# Altium schematic sheet P1.schdoc (part 3 of 3)
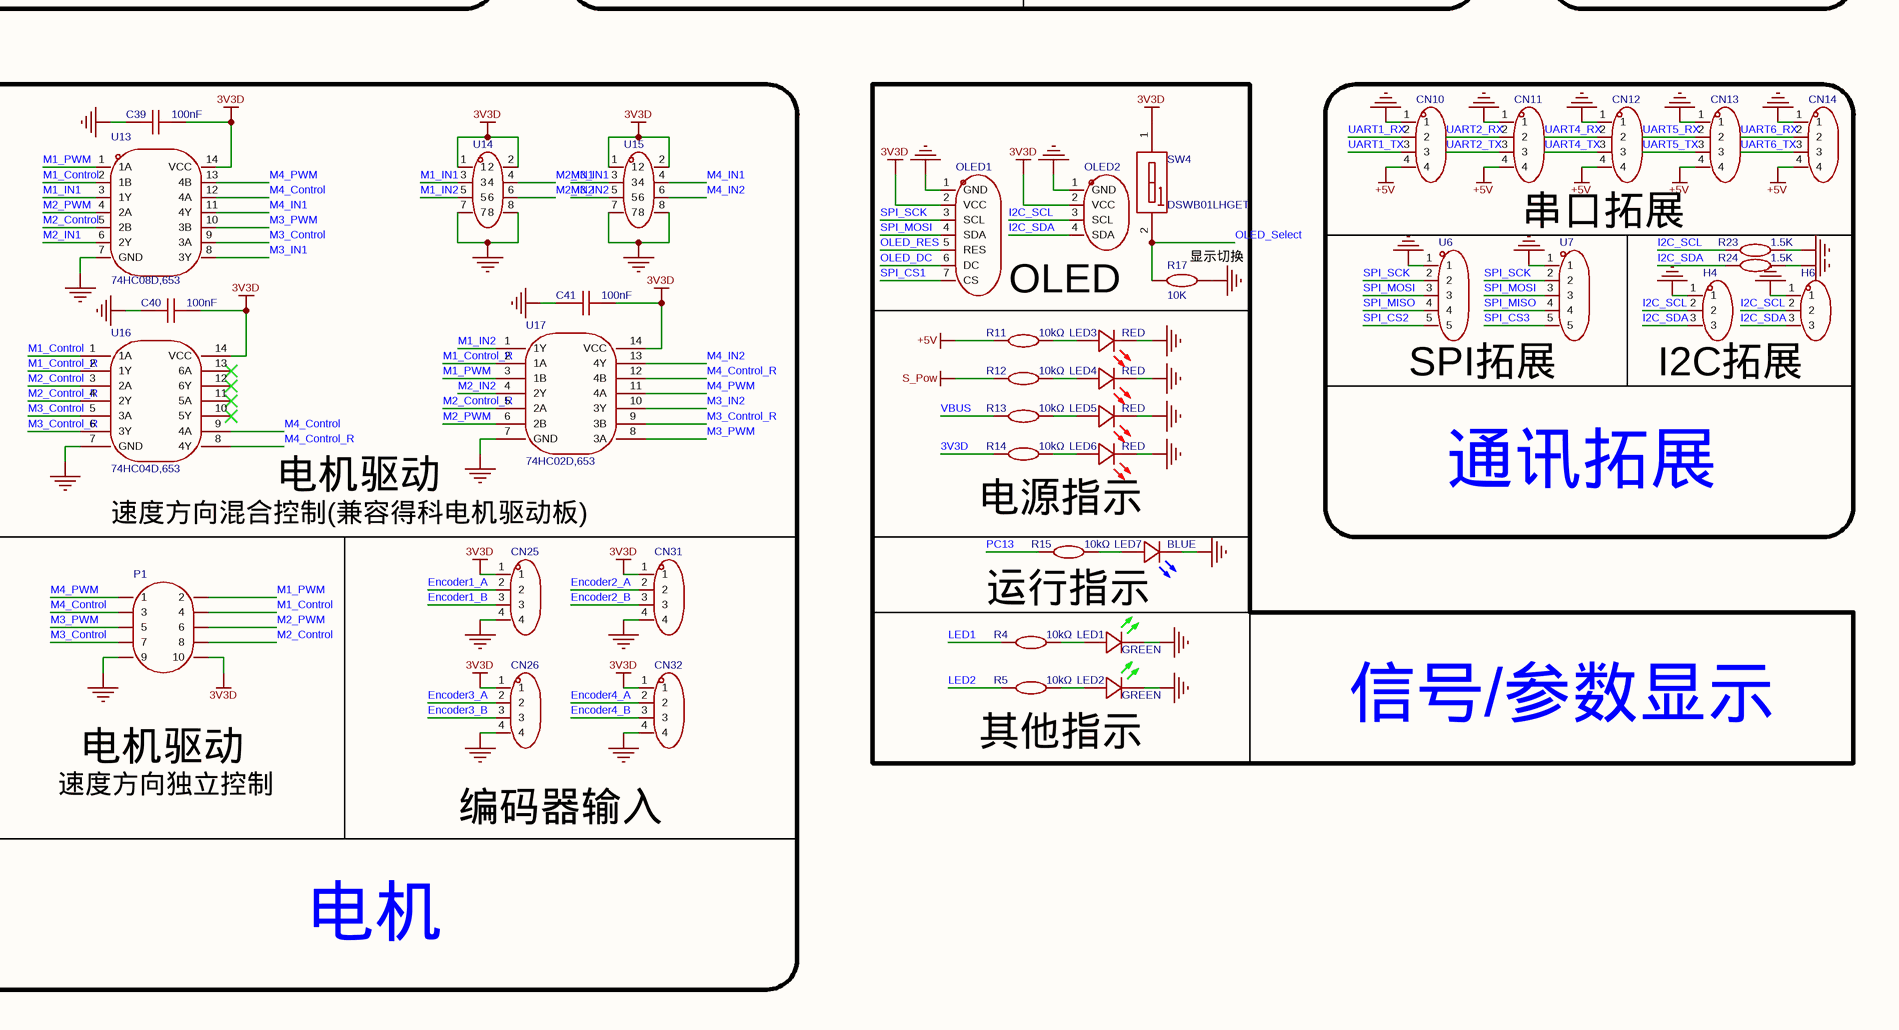
[diagram p5: P1.schdoc, bottom right]

## Library data of the parts (continued)
U14 U15 = XDFH-0254-2*4P: 连接器类型:简牛座;间距:2.54mm;结构:2x4P;额定电流:3A;额定电压:500V;安装方式:直插;排数:2;每排PIN数:4;触头材质:铜;触头镀层:金;工作温度:-45℃~+105℃;; Manufacturer: LX(连欣科技); AddInBom: yes; ModelId: 35a8e346d0b6435b92edcaed6c40b792聨0819f05c4eef4c71ace90d822a990e87; ModelTransform: 699.21112,350.7867,0,0,0,0,0,3.937,-125.984; Connector Type: 简牛座; Pitch: 2.54mm; Number of Positions or Pins: 2x4P; Current Rating: 3A; Voltage Rating (Max): 500V; Holder Type: 直插; Number of PINs Per Row: 4; Symbol: XDFH-0254-2*4P; Device: XDFH-0254-2*4P; LCSC Part Name: 镀2U全金品质简牛插座PH2.54MM-2*4PIN直插板 DIP; SupplierPart: C19193806; ManufacturerPart: XDFH-0254-2*4P; Supplier Footprint: 插件,P=2.54mm; JLCPCB Part Class: Extended Part; Datasheet: https://item.szlcsc.com/datasheet/XDFH-0254-2*4P/20445776.html; Supplier: LCSC; ConvertToPcb: yes; FootprintName: CONN-TH_8P-P2.54_LX_XDFH-0254-2X4P; ModelName: CONN-TH_8P-P2.54_LX_XDFH-0254-2X4P; Number of Rows: 2; Contact Material: 铜; Contact Plating: 金; Operating Temperature: -45℃~+105℃
U16 = 74HC04D,653: 输入类型:-;工作电压:2V~6V;静态电流(Iq):2uA;通道数:6;传播延迟(tpd):14ns@6V,50pF;; Manufacturer: Nexperia(安世); AddInBom: yes; ModelId: 8dbf5b715d42428c85558507ae5a252b聨0819f05c4eef4c71ace90d822a990e87; ModelName: SOIC-14_L8.6-W3.9-H1.8-LS6.0-P1.27; ModelTransform: 338.583,236.22,0,0,0,0,0,0.001,0; Voltage - Supply: 2V~6V; Quiescent Current(Iq): 2uA; Number of Circuits: 6; Number of Inputs: 1; Current - Output Low(IOL): 5.2mA; Input Logic Level - High: 1.5V~4.2V; Input Logic Level -Low: 500mV~1.8V; Output Logic Level - High: 3.7V；5.2V；1.9V; Output Logic Level - Low: 400mV；400mV；100mV; Symbol: 74HC04D,653; Device: 74HC04D,653; LCSC Part Name: 六路反相器; SupplierPart: C5590; ManufacturerPart: 74HC04D,653; Supplier Footprint: SOIC-14; JLCPCB Part Class: Extended Part; Datasheet: https://item.szlcsc.com/datasheet/74HC04D%252C653/6041.html; Supplier: LCSC; ConvertToPcb: yes; FootprintName: SOIC-14_L8.7-W3.9-P1.27-LS6.0-BL; Input Type: -; Current - Output High(IOH): 5.2mA; Propagation Delay: 14ns@6V,50pF; Series: 74HC系列; Operating Temperature: -40℃~+125℃
U17 = 74HC02D,653: 逻辑类型:或非门;通道数:4;工作电压:2V~6V;静态电流(Iq):2uA;传播延迟(tpd):15ns@6V,50pF;; Manufacturer: Nexperia(安世); AddInBom: yes; ModelId: 8dbf5b715d42428c85558507ae5a252b聨0819f05c4eef4c71ace90d822a990e87; ModelName: SOIC-14_L8.6-W3.9-H1.8-LS6.0-P1.27; ModelTransform: 338.583,236.22,0,0,0,0,0,0.001,0; Logic Type: 或非门; Number of Channels: 4; Voltage - Supply: 2V~6V; Quiescent Current: 2uA; Current - Output Low(IOL): 5.2mA; Input Logic Level - High: 1.5V~4.2V; Input Logic Level - Low: 500mV~1.8V; Output Logic Level - High: 5.9V；5.2V; Output Logic Level - Low: 400mV; Input Number: 2; Symbol: 74HC02D,653; Device: 74HC02D,653; LCSC Part Name: 四路2输入或非门; SupplierPart: C5588; ManufacturerPart: 74HC02D,653; Supplier Footprint: SOIC-14; JLCPCB Part Class: Extended Part; Datasheet: https://item.szlcsc.com/datasheet/74HC02D%252C653/6039.html; Supplier: LCSC; ConvertToPcb: yes; FootprintName: SOIC-14_L8.7-W3.9-P1.27-LS6.0-BL; Current - Output High(IOH): 5.2mA; Series: 74HC系列; Propagation Delay: 15ns@6V,50pF; Operating Temperature: -40℃~+125℃
USB1 = TYPE-C 16PIN 2MD(073): 连接器类型:Type-C;协议标准:-;公母:母;安装方式:卧贴;触点数量:16P;端口数量:1;额定电流 - 电源:3A;工作温度:-25℃~+85℃;; Manufacturer: SHOU HAN(首韩); AddInBom: yes; ModelId: 3a41b9ec9b654a0fad4d118405ec6290聨0819f05c4eef4c71ace90d822a990e87; ModelName: USB-C-SMD_TYPE-C-6PIN-2MD-073; ModelTransform: 351.9678,298.4246,0,0,0,0,0,-47.244,-35.433; Gender: 母; Number of Contacts: 16P; Number of Ports: 1; Current Rating-Power: 3A; Voltage Rating: 5V; Connect-Disconnect Life: 1万次; Detection color: 黑色; Symbol: TYPE-C 16PIN 2MD(073); Device: TYPE-C 16PIN 2MD(073); LCSC Part Name: Type-C 母 卧贴; SupplierPart: C2765186; ManufacturerPart: TYPE-C 16PIN 2MD(073); Supplier Footprint: SMD; JLCPCB Part Class: Extended Part; Datasheet: https://item.szlcsc.com/datasheet/TYPE-C%252016PIN%25202MD(073)/2901843.html; Supplier: LCSC; ConvertToPcb: yes; FootprintName: USB-C-SMD_TYPE-C-16PIN-2MD-073; Connector Type: Type-C; Protocol Standard: -; Mounting Type: 卧贴; Supplementary Features: -; Center Height: -; Length: -; Operating Temperature: -25℃~+85℃
X1 = YG8MLBBE2X: 晶振类型:直插晶振;频率:8MHz;常温频差:±10ppm;负载电容:20pF;频率稳定度:±30ppm;; Manufacturer: YJX(雅晶鑫); AddInBom: yes; ModelId: 78afa30f9d9445b0a61061568bfe1c65聨0819f05c4eef4c71ace90d822a990e87; ModelTransform: 434.03567,183.0705,0,0,0,0,0,0,-196.85; Normal temperature Frequency Tolerance: ±10ppm; Load Capacitance: 20pF; Frequency Stability: ±30ppm; Equivalent Series Resistance(ESR): 80Ω; Symbol: YG8MLBBE2X; Device: YG8MLBBE2X; LCSC Part Name: 49S 8M 20PF 10PPM; SupplierPart: C42441034; ManufacturerPart: YG8MLBBE2X; Supplier Footprint: HC-49S; JLCPCB Part Class: Extended Part; Datasheet: https://item.szlcsc.com/datasheet/YG8MLBBE2X/44488494.html; Supplier: LCSC; ConvertToPcb: yes; FootprintName: CRYSTAL-TH_L11.1-W4.7-P4.88; ModelName: CRYSTAL-TH_L11.1-W4.7-P4.88; Type: 直插晶振; Value: 8MHz; Operating Temperature: -20℃~+70℃
X2 = Q13FC13500004_C32346: 晶振类型:贴片晶振;频率:32.768kHz;常温频差:±20ppm;负载电容:12.5pF;; Manufacturer: EPSON(爱普生); Symbol: Q13FC1350000400; AddInBom: yes; ModelId: 751105e878f044059ef0ee72de95f96e聨0819f05c4eef4c71ace90d822a990e87; ModelTransform: 125.984,59.055,0,0,0,0,0,0,0; Normal temperature Frequency Tolerance: ±20ppm; Load Capacitance: 12.5pF; Equivalent Series Resistance(ESR): 70kΩ; Device: Q13FC13500004_C32346; LCSC Part Name: 32.768kHz ±20ppm 12.5pF; SupplierPart: C32346; ManufacturerPart: Q13FC13500004; Supplier Footprint: SMD3215-2P; JLCPCB Part Class: Basic Part; Datasheet: https://item.szlcsc.com/datasheet/Q13FC13500004/33310.html; Supplier: LCSC; ConvertToPcb: yes; FootprintName: FC-135R_L3.2-W1.5; ModelName: FC-135R_L3.2-W1.5; Type: 贴片晶振; Value: 32.768kHz; Operating Temperature: -40℃~+85℃